# Altium project PCB_Project.PrjPcb
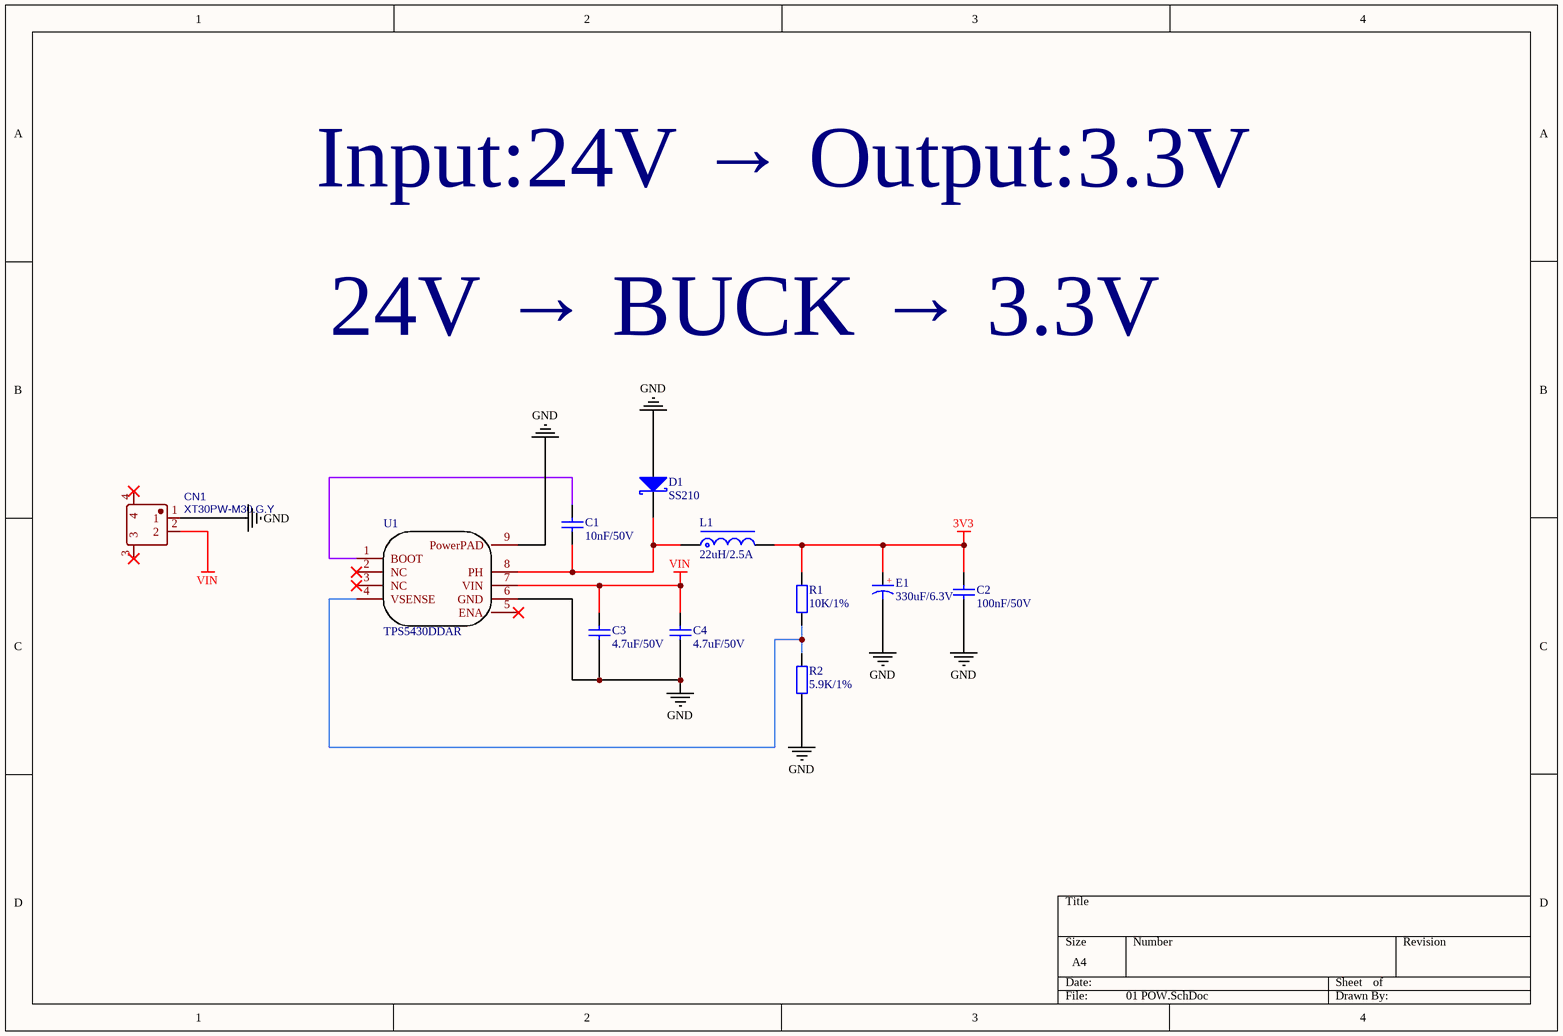
[diagram p0: 01 POW.SchDoc]
4 sheets, 80 parts. Net scope: global (net labels, ports and power ports of the same name join across sheets).
Board file: PCB1.PcbDoc
Sheets:
  01 POW.SchDoc
  02 MCU.SchDoc
  03 DRV.SchDoc
  04 Sensing.SchDoc

## Sheet 01 POW.SchDoc
size A4; SheetNumber: 1; SheetTotal: 4

### Parts
C1  10nF/50V  [C0603_L]
C2  100nF/50V  [C0603_L]
C3  4.7uF/50V  [C1206_L]
C4  4.7uF/50V  [C1206_L]
CN1  XT30PW-M30.G.Y  [XT30PW-M]
D1  SS210  [SMA]
E1  330uF/6.3V  [CE D(6.3*5.4)]
L1  22uH/2.5A  [L-SMD-0630]
R1  10K/1%  [R0603_L]
R2  5.9K/1%  [R0603_L]
U1  TPS5430DDAR  [SOIC-8_EP]

### Nets
3V3: C2.2 E1.1 L1.2 R1.2  [project net VBAT]
GND: C2.1 C3.1 C4.1 CN1.1 D1.1(A) E1.2 R2.1 U1.6(GND) U1.9(PowerPAD)  [project net SN]
VIN: C3.2 C4.2 CN1.2 U1.7(VIN)
NetC1_1: C1.1 D1.2(K) L1.1 U1.8(PH)
NetC1_2: C1.2 U1.1(BOOT)
NetR1_1: R1.1 R2.2 U1.4(VSENSE)

Not connected (* = marked no-connect by the designer): CN1 3* 4*; U1 2(NC)* 3(NC)* 5(ENA)*

### Notes on the sheet
- Input:24V → Output:3.3V
- 24V → BUCK → 3.3V
- (in symbol CE_SMD) +

### Library data of the parts
C1 = C: 0603B103K500NT; BOM名称: 无极性贴片电容; 联系卖家，免费查找封装: 唯一出售店铺网址https://shop463601444.taobao.com
C2 = C: CC0603KRX7R9BB104; BOM名称: 无极性贴片电容; 联系卖家，免费查找封装: 唯一出售店铺网址https://shop463601444.taobao.com
C3 C4 = C: 1206B475K500NT; BOM名称: 无极性贴片电容; 联系卖家，免费查找封装: 唯一出售店铺网址https://shop463601444.taobao.com
CN1 = XT30PW-M: BOM_Manufacturer: Changzhou Amass Elec; Contributor: LCSC; BOM_Supplier: LCSC; BOM_Supplier Part: C431092; BOM_Manufacturer Part: XT30PW-M; BOM_JLCPCB Part Class: Extended Part; spicePre: C; spiceSymbolName: XT30PW-M
D1 = SS14: BOM名称: 肖特基二极管; 属性: 40V/1A; 联系卖家，免费查找封装: 唯一出售店铺网址https://shop463601444.taobao.com
E1 = CE_SMD: RVT0J331M0605; BOM名称: 贴片电解电容; 联系卖家，免费查找封装: 唯一出售店铺网址https://shop463601444.taobao.com
L1 = L-Molding Choke: FXL0630-220-M; BOM名称: 一体成型电感; 联系卖家，免费查找封装: 唯一出售店铺网址https://shop463601444.taobao.com
R1 = R: 0603WAF1002T5E; BOM名称: 贴片电阻; 联系卖家，免费查找封装: 唯一出售店铺网址https://shop463601444.taobao.com
R2 = R: 0603WAF5901T5E; BOM名称: 贴片电阻; 联系卖家，免费查找封装: 唯一出售店铺网址https://shop463601444.taobao.com

## Sheet 02 MCU.SchDoc
size A4; SheetNumber: 2; SheetTotal: 4
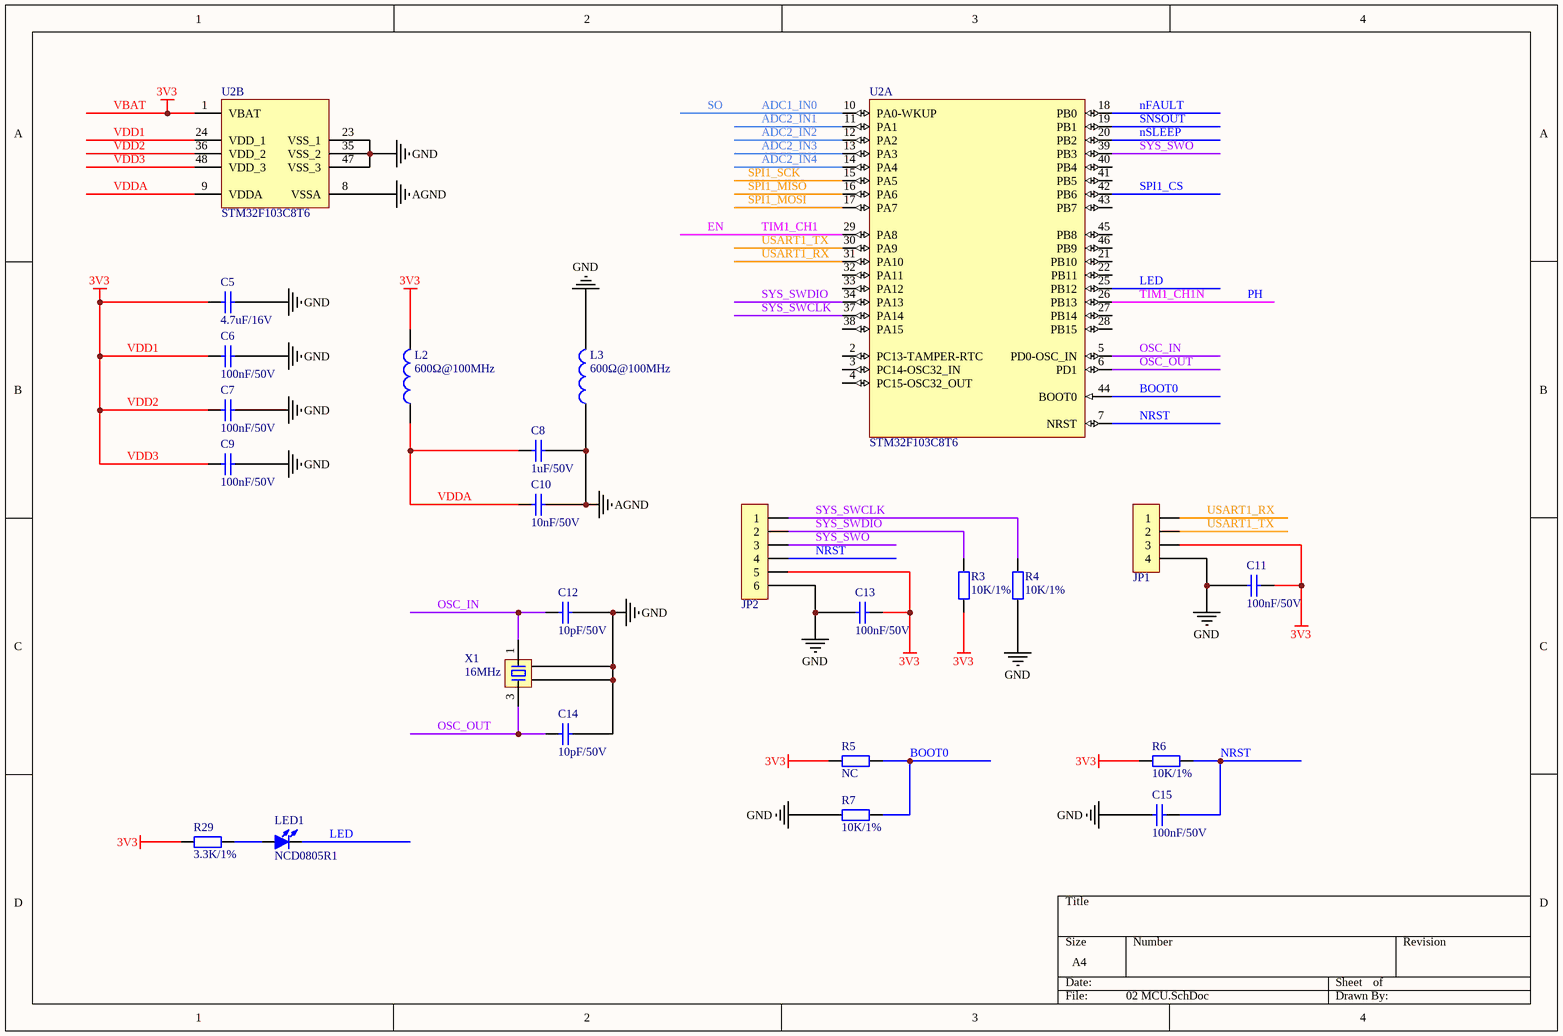
[diagram p1: 02 MCU.SchDoc]

### Parts
C5  4.7uF/16V  [C0603_L]
C6  100nF/50V  [C0603_L]
C7  100nF/50V  [C0603_L]
C8  1uF/50V  [C0603_L]
C9  100nF/50V  [C0603_L]
C10  10nF/50V  [C0603_L]
C11  100nF/50V  [C0603_L]
C12  10pF/50V  [C0603_L]
C13  100nF/50V  [C0603_L]
C14  10pF/50V  [C0603_L]
C15  100nF/50V  [C0603_L]
JP1  ZX-MX1.25-4PZZ  [MX1.25-LI-4P]  (value not drawn)
JP2  ZX-MX1.25-6PZZ  [MX1.25-LI-6P]  (value not drawn)
L2  600Ω@100MHz  [L0603]
L3  600Ω@100MHz  [L0603]
LED1  NCD0805R1  [LED0805_R]
R3  10K/1%  [R0603_L]
R4  10K/1%  [R0603_L]
R5  NC  [R0603_L]
R6  10K/1%  [R0603_L]
R7  10K/1%  [R0603_L]
R29  3.3K/1%  [R0603_L]
U2  STM32F103C8T6  [LQFP48_N]  (parts A,B of 2)
X1  16MHz  [XTAL-3225-4P]

### Nets
AGND: C8.1 C10.1 L3.1 U2.8(VSSA)
GND: C5.1 C6.1 C7.1 C9.1 C11.2 C12.1 C13.2 C14.1 C15.2 JP1.4 JP2.6 L3.2 R4.1 R7.2 U2.23(VSS_1) U2.35(VSS_2) U2.47(VSS_3) X1.2 X1.4  [project net SN]
VBAT: C5.2 C6.2 C7.2 C9.2 C11.1 C13.1 JP1.3 JP2.5 L2.2 R3.1 R5.2 R6.2 R29.2 U2.1(VBAT) U2.24(VDD_1) U2.36(VDD_2) U2.48(VDD_3)  [also labelled 3V3, VDD1, VDD2, VDD3]
ADC1_IN0: U2.10(PA0-WKUP)  [also labelled SO]
ADC2_IN1: U2.11(PA1)
ADC2_IN2: U2.12(PA2)
ADC2_IN3: U2.13(PA3)
ADC2_IN4: U2.14(PA4)
BOOT0: R5.1 R7.1 U2.44(BOOT0)
EN: U2.29(PA8)  [also labelled TIM1_CH1]
LED: LED1.2(K) U2.25(PB12)
nFAULT: U2.18(PB0)
NRST: C15.1 JP2.4 R6.1 U2.7(NRST)
nSLEEP: U2.20(PB2)
OSC_IN: C12.2 U2.5(PD0-OSC_IN) X1.1
OSC_OUT: C14.2 U2.6(PD1) X1.3
PH: U2.26(PB13)  [also labelled TIM1_CH1N]
SNSOUT: U2.19(PB1)
SPI1_CS: U2.42(PB6)
SPI1_MISO: U2.16(PA6)
SPI1_MOSI: U2.17(PA7)
SPI1_SCK: U2.15(PA5)
SYS_SWCLK: JP2.1 R4.2 U2.37(PA14)
SYS_SWDIO: JP2.2 R3.2 U2.34(PA13)
SYS_SWO: JP2.3 U2.39(PB3)
USART1_RX: JP1.1 U2.31(PA10)
USART1_TX: JP1.2 U2.30(PA9)
VDDA: C8.2 C10.2 L2.1 U2.9(VDDA)
NetLED1_1: LED1.1(A) R29.1

Not connected (* = marked no-connect by the designer): U2 2(PC13-TAMPER-RTC) 3(PC14-OSC32_IN) 4(PC15-OSC32_OUT) 21(PB10) 22(PB11) 27(PB14) 28(PB15) 32(PA11) 33(PA12) 38(PA15) 40(PB4) 41(PB5) 43(PB7) 45(PB8) 46(PB9)

### Library data of the parts
C5 = C: CL10A475KO8NNNC; BOM名称: 无极性贴片电容; 联系卖家，免费查找封装: 唯一出售店铺网址https://shop463601444.taobao.com
C6 C7 C9 C11 C13 C15 = C: as C2 on sheet 01 POW
C8 = C: CL10A105KB8NNNC; BOM名称: 无极性贴片电容; 联系卖家，免费查找封装: 唯一出售店铺网址https://shop463601444.taobao.com
C10 = C: as C1 on sheet 01 POW
C12 C14 = C: CL10C100JB8NNNC; BOM名称: 无极性贴片电容; 联系卖家，免费查找封装: 唯一出售店铺网址https://shop463601444.taobao.com
JP1 = Header 4: BOM名称: 4P连接器; 联系卖家，免费技术支持: 唯一出售店铺网址https://shop463601444.taobao.com; 联系卖家 免费技术支持: 封装库来自淘宝卖家ID：黄晶宝石
JP2 = Header 6: BOM名称: 6P连接器; 联系卖家，免费技术支持: 唯一出售店铺网址https://shop463601444.taobao.com; 联系卖家 免费技术支持: 封装库来自淘宝卖家ID：黄晶宝石
L2 L3 = L: GZ1608D601TF; BOM名称: 小功率贴片电感; 联系卖家，免费查找封装: 唯一出售店铺网址https://shop463601444.taobao.com
LED1 = LED-SMD: BOM名称: 贴片LED; 联系卖家 免费查找封装: 封装库来自淘宝卖家ID：黄晶宝石
R3-R7 = R: as R1 on sheet 01 POW
R29 = R: 0603WAF3301T5E; BOM名称: 贴片电阻; 联系卖家，免费查找封装: 唯一出售店铺网址https://shop463601444.taobao.com
U2 = STM32F103C8T6: STM32 ARM-based 32-bit MCU Performance Line with 64 kB Flash, 20 kB Internal RAM, -40 to +85癈 Temperature, 48-Pin LQFP, Tray; 联系卖家，免费查找封装: 唯一出售店铺网址https://shop463601444.taobao.com; DatasheetVersion: rev13.0, Apr-2011; PackageVersion: rev13, Apr-2011; PackageReference: LQFP48; PackageDescription: 48-Pin Low-Profile Quad Flat Pack, 7 x 7 mm Body, 0.5 mm Pitch (LQFP48); ComponentLink1Description: Manufacturer URL; ComponentLink1URL: http://www.st.com/; ComponentLink2Description: STM32F103 Datasheet; ComponentLink2URL: http://www.st.com/internet/com/TECHNICAL_RESOURCES/TECHNICAL_LITERATURE/DATASHEET/CD00161566.pdf; ComponentLink3Description: STM32 Family Web Page; ComponentLink3URL: www.st.com/stm32
X1 = XTAL-4P: X322516MLB4SI; BOM名称: 4脚无源晶振(谐振器）; 联系卖家，免费查找封装: 唯一出售店铺网址https://shop463601444.taobao.com

## Sheet 03 DRV.SchDoc
size A4; SheetNumber: 3; SheetTotal: 4
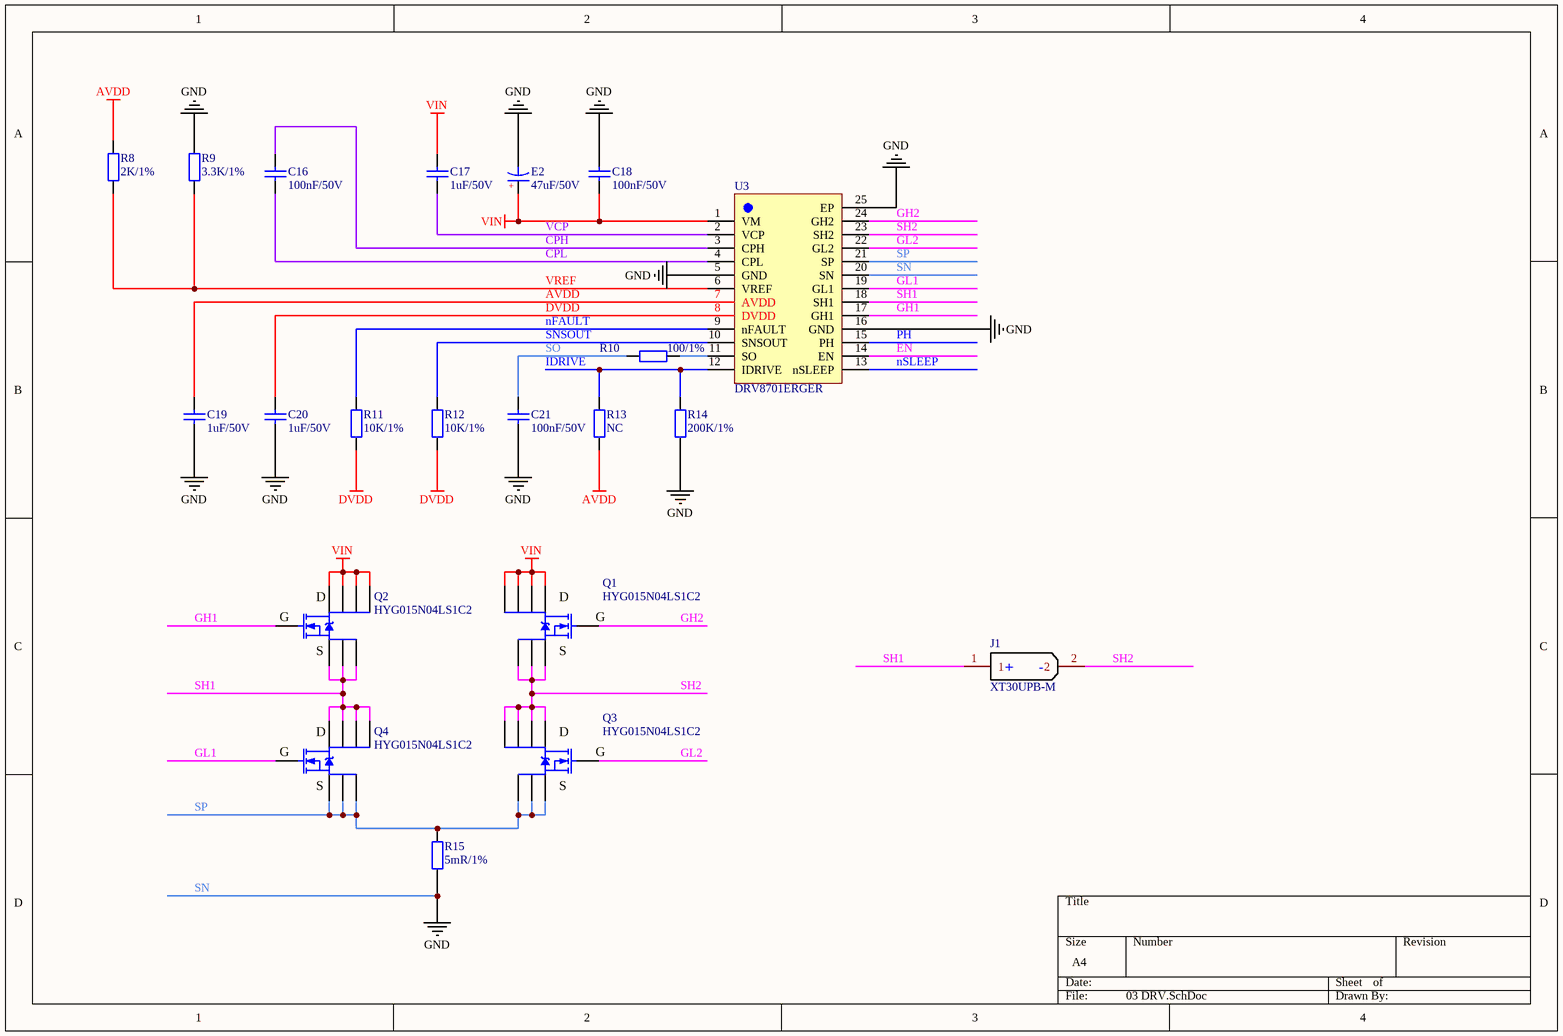
[diagram p2: 03 DRV.SchDoc]

### Parts
C16  100nF/50V  [C0603_L]
C17  1uF/50V  [C0603_L]
C18  100nF/50V  [C0603_L]
C19  1uF/50V  [C0603_L]
C20  1uF/50V  [C0603_L]
C21  100nF/50V  [C0603_L]
E2  47uF/50V  [CE D(6.3*5.4)]
J1  XT30UPB-M  [XT30-M]
Q1  HYG015N04LS1C2  [PowerFLAT-8(5x6)]
Q2  HYG015N04LS1C2  [PowerFLAT-8(5x6)]
Q3  HYG015N04LS1C2  [PowerFLAT-8(5x6)]
Q4  HYG015N04LS1C2  [PowerFLAT-8(5x6)]
R8  2K/1%  [R0603_L]
R9  3.3K/1%  [R0603_L]
R10  100/1%  [R0603_L]
R11  10K/1%  [R0603_L]
R12  10K/1%  [R0603_L]
R13  NC  [R0603_L]
R14  200K/1%  [R0603_L]
R15  5mR/1%  [R2512_L]
U3  DRV8701ERGER  [VQFN-24]

### Nets
AVDD: C19.1 R8.2 R13.2 U3.7(AVDD)
DVDD: C20.1 R11.1 R12.1 U3.8(DVDD)
SN: C18.1 C19.2 C20.2 C21.1 E2.2 R9.2 R14.2 R15.1 U3.5(GND) U3.16(GND) U3.20(SN) U3.25(EP)  [also labelled GND]
VIN: C17.2 C18.2 E2.1 Q1.5(D) Q1.6(D) Q1.7(D) Q1.8(D) Q2.5(D) Q2.6(D) Q2.7(D) Q2.8(D) U3.1(VM)
CPH: C16.2 U3.3(CPH)
CPL: C16.1 U3.4(CPL)
EN: U3.14(EN)
GH1: Q2.4(G) U3.17(GH1)
GH2: Q1.4(G) U3.24(GH2)
GL1: Q4.4(G) U3.19(GL1)
GL2: Q3.4(G) U3.22(GL2)
IDRIVE: R13.1 R14.1 U3.12(IDRIVE)
nFAULT: R11.2 U3.9(nFAULT)
nSLEEP: U3.13(nSLEEP)
PH: U3.15(PH)
SH1: J1.1 Q2.1(S) Q2.2(S) Q2.3(S) Q4.5(D) Q4.6(D) Q4.7(D) Q4.8(D) U3.18(SH1)
SH2: J1.2 Q1.1(S) Q1.2(S) Q1.3(S) Q3.5(D) Q3.6(D) Q3.7(D) Q3.8(D) U3.23(SH2)
SNSOUT: R12.2 U3.10(SNSOUT)
SO: C21.2 R10.2  [project net ADC1_IN0]
SP: Q3.1(S) Q3.2(S) Q3.3(S) Q4.1(S) Q4.2(S) Q4.3(S) R15.2 U3.21(SP)
VCP: C17.1 U3.2(VCP)
VREF: R8.1 R9.1 U3.6(VREF)
NetR10_1: R10.1 U3.11(SO)

### Notes on the sheet
- (in symbol CE_SMD) +
- (in symbol XT-60) +; -

### Library data of the parts
C16 C18 C21 = C: as C2 on sheet 01 POW
C17 C19 C20 = C: as C8 on sheet 02 MCU
E2 = CE_SMD: RV50V47M6X5; BOM名称: 贴片电解电容; 联系卖家，免费查找封装: 唯一出售店铺网址https://shop463601444.taobao.com
J1 = XT-60
Q1-Q4 = STL90N10F7
R8 = R: 0603WAF2001T5E; BOM名称: 贴片电阻; 联系卖家，免费查找封装: 唯一出售店铺网址https://shop463601444.taobao.com
R9 = R: as R29 on sheet 02 MCU
R10 = R: 0603WAF1000T5E; BOM名称: 贴片电阻; 联系卖家，免费查找封装: 唯一出售店铺网址https://shop463601444.taobao.com
R11 R12 = R: as R1 on sheet 01 POW
R13 = R: 0603WAF6802T5E; BOM名称: 贴片电阻; 联系卖家，免费查找封装: 唯一出售店铺网址https://shop463601444.taobao.com
R14 = R: 0603WAF2003T5E; BOM名称: 贴片电阻; 联系卖家，免费查找封装: 唯一出售店铺网址https://shop463601444.taobao.com
R15 = R: HoJLR2512-3W-5mR-1%; BOM名称: 贴片电阻; 联系卖家，免费查找封装: 唯一出售店铺网址https://shop463601444.taobao.com
U3 = DRV8701ERGER: DRV8701 DRV8701 H 桥栅极驱动器

## Sheet 04 Sensing.SchDoc
size A4; SheetNumber: 4; SheetTotal: 4
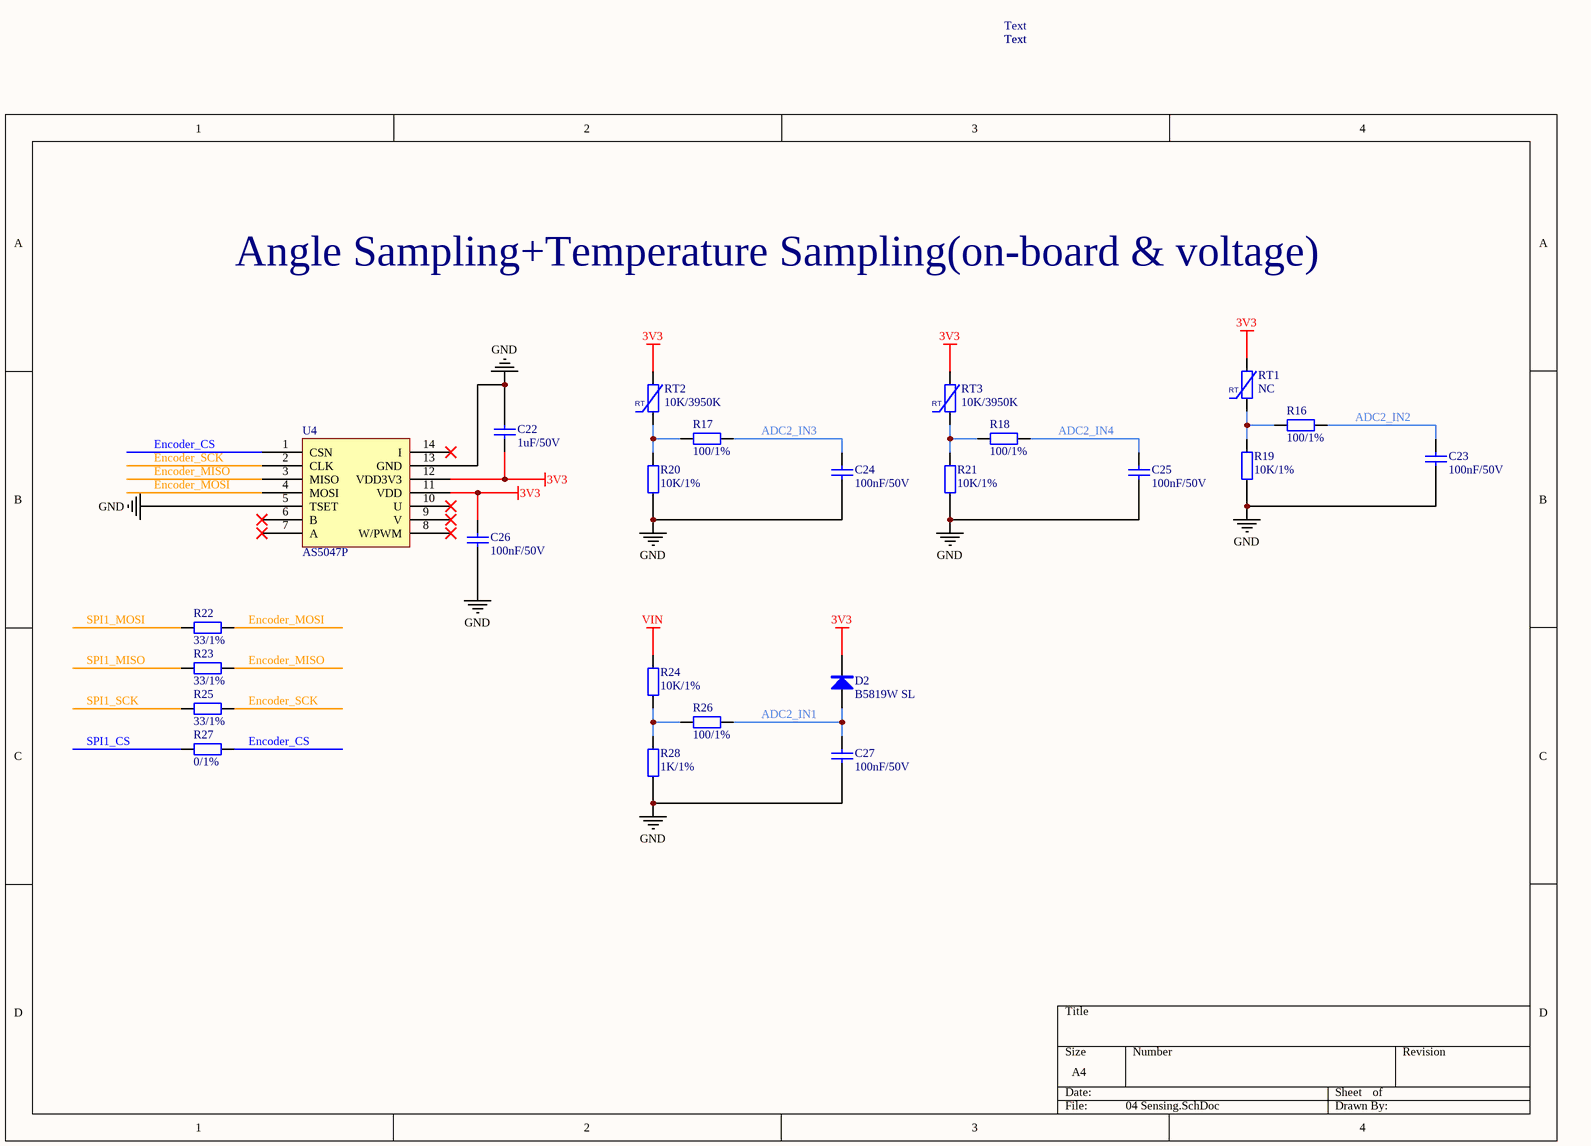
[diagram p3: 04 Sensing.SchDoc]

### Parts
C22  1uF/50V  [C0603_L]
C23  100nF/50V  [C0603_L]
C24  100nF/50V  [C0603_L]
C25  100nF/50V  [C0603_L]
C26  100nF/50V  [C0603_L]
C27  100nF/50V  [C0603_L]
D2  B5819W SL  [SOD-123]
R16  100/1%  [R0603_L]
R17  100/1%  [R0603_L]
R18  100/1%  [R0603_L]
R19  10K/1%  [R0603_L]
R20  10K/1%  [R0603_L]
R21  10K/1%  [R0603_L]
R22  33/1%  [R0603_L]
R23  33/1%  [R0603_L]
R24  10K/1%  [R0603_L]
R25  33/1%  [R0603_L]
R26  100/1%  [R0603_L]
R27  0/1%  [R0603_L]
R28  1K/1%  [R0603_L]
RT1  NC  [R0805-HP_L]
RT2  10K/3950K  [R0805-HP_L]
RT3  10K/3950K  [R0805-HP_L]
U4  AS5047P  [TSSOP14_L]

### Nets
3V3: C22.2 C26.1 D2.2(K) RT1.2 RT2.2 RT3.2 U4.11(VDD) U4.12(VDD3V3)  [project net VBAT]
GND: C22.1 C23.2 C24.2 C25.2 C26.2 C27.2 R19.1 R20.1 R21.1 R28.1 U4.5(TSET) U4.13(GND)  [project net SN]
VIN: R24.2
ADC2_IN1: C27.1 D2.1(A) R26.2
ADC2_IN2: C23.1 R16.2
ADC2_IN3: C24.1 R17.2
ADC2_IN4: C25.1 R18.2
Encoder_CS: R27.1 U4.1(CSN)
Encoder_MISO: R23.1 U4.3(MISO)
Encoder_MOSI: R22.1 U4.4(MOSI)
Encoder_SCK: R25.1 U4.2(CLK)
SPI1_CS: R27.2
SPI1_MISO: R23.2
SPI1_MOSI: R22.2
SPI1_SCK: R25.2
NetR16_1: R16.1 R19.2 RT1.1
NetR17_1: R17.1 R20.2 RT2.1
NetR18_1: R18.1 R21.2 RT3.1
NetR24_1: R24.1 R26.1 R28.2

Not connected (* = marked no-connect by the designer): U4 6(B)* 7(A)* 8(W/PWM)* 9(V)* 10(U)* 14(I)*

### Notes on the sheet
- Text
- Angle Sampling+Temperature Sampling(on-board & voltage)

### Library data of the parts
C22 = C: as C8 on sheet 02 MCU
C23-C27 = C: as C2 on sheet 01 POW
D2 = 1N4007: BOM名称: 整流二极管; 联系卖家，免费查找封装: 唯一出售店铺网址https://shop463601444.taobao.com
R16-R18 R26 = R: as R10 on sheet 03 DRV
R19-R21 R24 = R: as R1 on sheet 01 POW
R22 R23 R25 = R: 0603WAF330JT5E; BOM名称: 贴片电阻; 联系卖家，免费查找封装: 唯一出售店铺网址https://shop463601444.taobao.com
R27 = R: 0603WAF0000T5E; BOM名称: 贴片电阻; 联系卖家，免费查找封装: 唯一出售店铺网址https://shop463601444.taobao.com
R28 = R: 0603WAF1001T5E; BOM名称: 贴片电阻; 联系卖家，免费查找封装: 唯一出售店铺网址https://shop463601444.taobao.com
RT1 = RT: MF52D 103F3435-100; BOM名称: 压敏电阻; 联系卖家，免费查找封装: 唯一出售店铺网址https://shop463601444.taobao.com
RT2 RT3 = RT: SDNT2012X103F3950FTF; BOM名称: 压敏电阻; 联系卖家，免费查找封装: 唯一出售店铺网址https://shop463601444.taobao.com
U4 = AS5047P: 14 Bit编码器

## Nets that join several sheets
SN: 01 POW (9 pins), 02 MCU (19 pins), 03 DRV (12 pins), 04 Sensing (12 pins)
VBAT: 01 POW (C2.2 E1.1 L1.2 R1.2), 02 MCU (17 pins), 04 Sensing (8 pins)
VIN: 01 POW (C3.2 C4.2 CN1.2 U1.7), 03 DRV (12 pins), 04 Sensing (R24.2)
ADC1_IN0: 02 MCU (U2.10), 03 DRV (C21.2 R10.2)
ADC2_IN1: 02 MCU (U2.11), 04 Sensing (C27.1 D2.1 R26.2)
ADC2_IN2: 02 MCU (U2.12), 04 Sensing (C23.1 R16.2)
ADC2_IN3: 02 MCU (U2.13), 04 Sensing (C24.1 R17.2)
ADC2_IN4: 02 MCU (U2.14), 04 Sensing (C25.1 R18.2)
EN: 02 MCU (U2.29), 03 DRV (U3.14)
nFAULT: 02 MCU (U2.18), 03 DRV (R11.2 U3.9)
nSLEEP: 02 MCU (U2.20), 03 DRV (U3.13)
PH: 02 MCU (U2.26), 03 DRV (U3.15)
SNSOUT: 02 MCU (U2.19), 03 DRV (R12.2 U3.10)
SPI1_CS: 02 MCU (U2.42), 04 Sensing (R27.2)
SPI1_MISO: 02 MCU (U2.16), 04 Sensing (R23.2)
SPI1_MOSI: 02 MCU (U2.17), 04 Sensing (R22.2)
SPI1_SCK: 02 MCU (U2.15), 04 Sensing (R25.2)